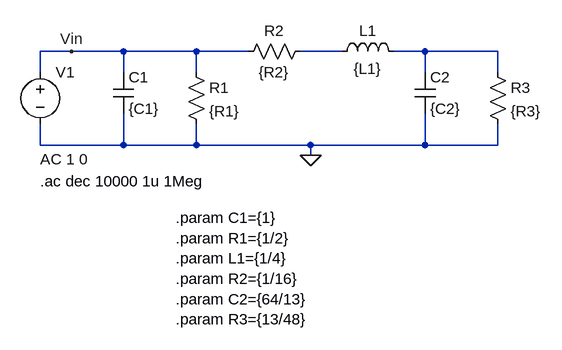
[diagram p0: schematic ejercicio1_convalores.asc]
ejercicio1_convalores.asc, the LTspice schematic file:
Version 4.1
SHEET 1 880 680
WIRE 16 80 -32 80
WIRE 96 80 16 80
WIRE 208 80 96 80
WIRE 288 80 208 80
WIRE 432 80 368 80
WIRE 560 80 512 80
WIRE 672 80 560 80
WIRE -32 112 -32 80
WIRE 96 112 96 80
WIRE 208 112 208 80
WIRE 560 112 560 80
WIRE 672 112 672 80
WIRE -32 224 -32 192
WIRE 96 224 96 176
WIRE 96 224 -32 224
WIRE 208 224 208 192
WIRE 208 224 96 224
WIRE 384 224 208 224
WIRE 560 224 560 176
WIRE 560 224 384 224
WIRE 672 224 672 192
WIRE 672 224 560 224
WIRE 384 240 384 224
FLAG 384 240 0
FLAG 16 80 Vin
SYMBOL cap 80 112 R0
SYMATTR InstName C1
SYMATTR Value {C1}
SYMBOL res 192 96 R0
SYMATTR InstName R1
SYMATTR Value {R1}
SYMBOL res 384 64 R90
WINDOW 0 0 56 VBottom 2
WINDOW 3 32 56 VTop 2
SYMATTR InstName R2
SYMATTR Value {R2}
SYMBOL ind 416 96 R270
WINDOW 0 32 56 VTop 2
WINDOW 3 5 56 VBottom 2
SYMATTR InstName L1
SYMATTR Value {L1}
SYMATTR SpiceLine Rser=1m
SYMBOL cap 544 112 R0
SYMATTR InstName C2
SYMATTR Value {C2}
SYMBOL res 656 96 R0
SYMATTR InstName R3
SYMATTR Value {R3}
SYMBOL voltage -32 96 R0
WINDOW 123 0 150 Left 2
WINDOW 39 0 0 Left 0
SYMATTR InstName V1
SYMATTR Value ""
SYMATTR Value2 AC 1 0
TEXT 176 336 Left 2 !.param C1={1}\n.param R1={1/2}\n.param L1={1/4}\n.param R2={1/16}\n.param C2={64/13}\n.param R3={13/48}
TEXT -32 280 Left 2 !.ac dec 10000 1u 1Meg

The netlist it stands for:
* ejercicio1_convalores.asc
C1 Vin 0 {C1}
R1 Vin 0 {R1}
R2 N001 Vin {R2}
L1 N001 N002 {L1} Rser=1m
C2 N002 0 {C2}
R3 N002 0 {R3}
V1 Vin 0 AC 1 0
.param C1={1}
.param R1={1/2}
.param L1={1/4}
.param R2={1/16}
.param C2={64/13}
.param R3={13/48}
.ac dec 10000 1u 1Meg
.backanno
.end